# Altium schematic sheet SMPS_Section.SchDoc
size A4
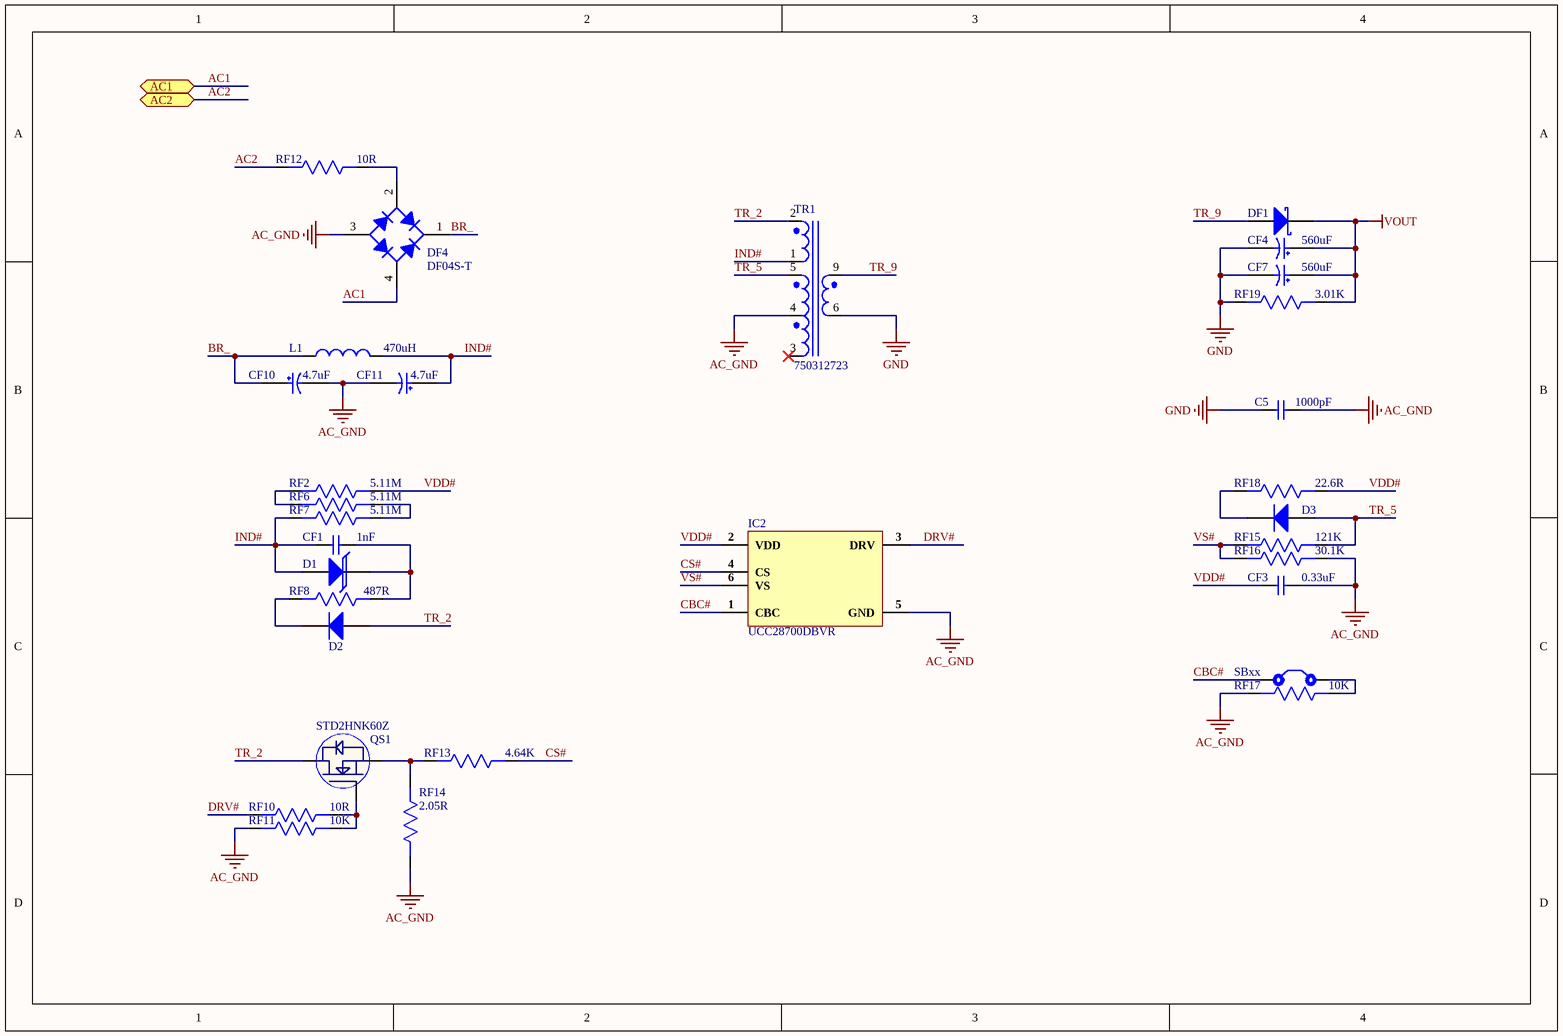
[diagram p0: SMPS_Section.SchDoc]

## Parts
C5  1000pF  [RAD-0.4]
CF1  1nF  [Cap0603]
CF3  0.33uF  [Cap0603]
CF4  560uF  [EEE-TC1A561UV]
CF7  560uF  [EEE-TC1A561UV]
CF10  4.7uF  [ULR2G4R7MNL1GS]
CF11  4.7uF  [ULR2G4R7MNL1GS]
D1  SMBJP6KE82A-TP  [SMB]  (value not drawn)
D2  MURS160-13  [SMB]  (value not drawn)
D3  RS1B-13-F  [SMA]  (value not drawn)
DF1  B340LB-13-F  [SMB]  (value not drawn)
DF4  DF04S-T  [DF04S-T]
IC2  UCC28700DBVR  [SOT-23-6]
L1  470uH  [84474C]
QS1  STD2HNK60Z  [STD2HNK60Z]
RF2  5.11M  [RES 0805]
RF6  5.11M  [RES 0805]
RF7  5.11M  [RES 0805]
RF8  487R  [Res0402]
RF10  10R  [Res0402]
RF11  10K  [Res0402]
RF12  10R  [RES 2512]
RF13  4.64K  [Res-0201]
RF14  2.05R  [Res0402]
RF15  121K  [Res0402]
RF16  30.1K  [Res0402]
RF17  10K  [Res0402]
RF18  22.6R  [Res0402]
RF19  3.01K  [Res-0201]
SBxx  Solder Bridge  [Solder Bridge]  (value not drawn)
TR1  750312723  [750312723]

## Ports
AC1 (bidir), AC2 (bidir)

## Nets
AC_GND: C5.2 CF3.2 CF10.2 CF11.2 DF4.3(-) IC2.5(GND) RF11.2 RF14.2 RF16.1 RF17.2 TR1.4
GND: C5.1 CF4.2 CF7.2 RF19.2 TR1.6
VOUT: CF4.1 CF7.1 DF1.2(K) RF19.1
AC1: DF4.4 ; port AC1
AC2: RF12.2 ; port AC2
BR_: CF10.1 DF4.1(+) L1.1
CBC#: IC2.1(CBC) SBxx.1
CS#: IC2.4(CS) RF13.1
DRV#: IC2.3(DRV) RF10.2
IND#: CF1.1 CF11.1 D1.1(A) L1.2 RF7.2 TR1.1
TR_2: D2.1(A) QS1.2(D) TR1.2
TR_5: D3.1(A) RF15.1 TR1.5
TR_9: DF1.1(A) TR1.9
VDD#: CF3.1 IC2.2(VDD) RF2.1 RF18.1
VS#: IC2.6(VS) RF15.2 RF16.2
NetCF1_2: CF1.2 D1.2(K) RF8.1
NetD2_2: D2.2(K) RF8.2
NetD3_2: D3.2(K) RF18.2
NetDF4_2: DF4.2(-) RF12.1
NetQS1_1: QS1.1(G) RF10.1 RF11.1
NetQS1_3: QS1.3(S) RF13.2 RF14.1
NetRF2_2: RF2.2 RF6.2
NetRF6_1: RF6.1 RF7.1
NetRF17_1: RF17.1 SBxx.2

Not connected (* = marked no-connect by the designer): TR1 3(NC)*

## Library data of the parts
C5 = 440LD10-R: CAP CER 1000PF 760VAC Y5U RADIAL; Manufacturer: Vishay; Voltage Rating: 300V; Lead/Base Style: Straight; Voltage: 760V; Dissipation Factor: 2%; Voltage Rating (DC): 400V; Capacitance: 1nF; Tolerance: 20%; Voltage Rating (AC): 500V; Lead Diameter: 0.81mm; Lead Length: 28.8mm; Supplier 1: Allied Electronics; Manufacturer Part Number: 440LD10-R; RoHS: Yes; Category: Ceramic Capacitors; Stock 1: 1070; Pricing 1: 1=0.59200, 25=0.46900, 100=0.45900, 250=0.43900, 500=0.40800, 1000=0.38800, 2500=0.37700 (USD); Mount: Through Hole,PCB; Case/Package: Radial; Weight: 0.01lb; Min Operating Temperature: -30°C; Max Operating Temperature: 125°C; Dielectric: Y5U; Termination: Radial; Resistor Type: Ceramic; Packaging: Bulk; Package Quantity: 250; Diameter: 9.3mm; Length: 2inch; Height: 5.7mm; Lead Pitch: 9.5mm; Width: 0.25inch; Height - Seated (Max): 0.492inch; Depth: 5.6mm; Radiation Hardening: No; Lead Free: Lead Free; REACH SVHC: Unknown; ComponentLink1URL: https://datasheet.ciiva.com/5383/440l-239711-5383856.pdf?src-supplier=Mouser; ComponentLink1Description: https://datasheet.ciiva.com/5383/440l-239711-5383856.pdf?src-supplier=Mouser; ComponentLink2URL: https://datasheet.ciiva.com/15164/getdatasheetpartid-107669-15164784.pdf?src-supplier=Verical; ComponentLink2Description: https://datasheet.ciiva.com/15164/getdatasheetpartid-107669-15164784.pdf?src-supplier=Verical; ComponentLink3URL: https://datasheet.ciiva.com/197/440lseries-197823.pdf?src-supplier=Digi-Key; ComponentLink3Description: https://datasheet.ciiva.com/197/440lseries-197823.pdf?src-supplier=Digi-Key; ComponentLink4URL: https://datasheet.ciiva.com/8031/1838975-8031887.pdf?src-supplier=Element14; ComponentLink4Description: https://datasheet.ciiva.com/8031/1838975-8031887.pdf?src-supplier=Element14; Supplier Part Number 1: 70079820
CF1 = 0603B102K201CT: CAP CER 1000PF 200V X7R 0603; Manufacturer: Walsin Technologies; Tolerance: 10%; Supplier 1: Digi-Key; Manufacturer Part Number: 0603B102K201CT; RoHS: No; Category: Ceramic Capacitors; Stock 1: 60399; Pricing 1: 1=0.10000, 10=0.06800, 50=0.03740, 100=0.03050, 500=0.02180, 1000=0.01712 (USD); Case/Package: 0603; Case Code (Metric): 1608; Case Code (Imperial): 0603; Min Operating Temperature: -55°C; Max Operating Temperature: 125°C; Voltage Rating: 200V; Packaging: Cut Tape; Voltage Rating (DC): 200V; Capacitance: 1nF; Dielectric: X7R; REACH SVHC: Unknown; ComponentLink1URL: http://www.farnell.com/datasheets/1958513.pdf?src-supplier=Farnell; ComponentLink1Description: http://www.farnell.com/datasheets/1958513.pdf?src-supplier=Farnell; ComponentLink2URL: http://www.farnell.com/datasheets/1958513.pdf?src-supplier=Element14; ComponentLink2Description: http://www.farnell.com/datasheets/1958513.pdf?src-supplier=Element14; ComponentLink3URL: http://www.passivecomponent.com/wp-content/uploads/2018/10/MLCC.pdf?src-supplier=Digi-Key; ComponentLink3Description: http://www.passivecomponent.com/wp-content/uploads/2018/10/MLCC.pdf?src-supplier=Digi-Key; Supplier Part Number 1: 1292-1379-1-ND
CF3 = CGA3E3X7R1H334M080AB: CAP CER 0.33UF 50V X7R 0603; Manufacturer: TDK; Capacitance: 330nF; Tolerance: 20%; Supplier 1: Digi-Key; Manufacturer Part Number: CGA3E3X7R1H334M080AB; RoHS: Yes; Category: Ceramic Capacitors; Stock 1: 4397; Pricing 1: 1=0.26000, 10=0.17600, 50=0.11760, 100=0.10000, 500=0.07056, 1000=0.06174 (USD); Mount: Surface Mount; Case/Package: 0603; Weight: 7.1E-05oz; Case Code (Imperial): 0603; Case Code (Metric): 1608; Min Operating Temperature: -55°C; Max Operating Temperature: 125°C; Dielectric: X7R; Termination: SMD/SMT; Voltage Rating (DC): 50V; Package Quantity: 4000; Packaging: Tape and Reel; Voltage Rating: 50V; Length: 0.063inch; Height: 0.8mm; Width: 0.031inch; Thickness: 0.035inch; Ratings: AEC-Q200; ComponentLink1URL: http://www.mouser.com/ds/2/400/lcc_automotive_general_en-843974.pdf?src-supplier=Mouser; ComponentLink1Description: http://www.mouser.com/ds/2/400/lcc_automotive_general_en-843974.pdf?src-supplier=Mouser; ComponentLink2URL: http://product.tdk.com/capacitor/mlcc/class/print_detail_pdf.php?lang=en&part_no=CGA3E3X7R1H334M080AB&src-supplier=Avnet; ComponentLink2Description: http://product.tdk.com/capacitor/mlcc/class/print_detail_pdf.php?lang=en&part_no=CGA3E3X7R1H334M080AB&src-supplier=Avnet; ComponentLink3URL: https://product.tdk.com/info/en/catalog/datasheets/mlcc_automotive_general_en.pdf?src-supplier=Digi-Key; ComponentLink3Description: https://product.tdk.com/info/en/catalog/datasheets/mlcc_automotive_general_en.pdf?src-supplier=Digi-Key; Supplier Part Number 1: 445-181020-1-ND
CF4 CF7 = EEE-TC1A561UV: CAP ALUM 560UF 20% 10V SMD; Manufacturer: Panasonic; Supplier 1: Digi-Key; Manufacturer Part Number: EEE-TC1A561UV; Stock 1: 500; Pricing 1: 1=1.23000, 10=0.96800, 50=0.83860, 100=0.72560 (USD); ComponentLink1URL: http://datasheet.octopart.com/EEE-TC1A561UV-Panasonic-datasheet-136612400.pdf?src-supplier=Electro+Sonic; ComponentLink1Description: http://datasheet.octopart.com/EEE-TC1A561UV-Panasonic-datasheet-136612400.pdf?src-supplier=Electro+Sonic; Supplier Part Number 1: P124843CT-ND
CF10 CF11 = ULR2G4R7MNL1GS: CAP ALUM 4.7UF 20% 400V SMD; Manufacturer: Nichicon; Ripple Current: 35mA; Leakage Current: 100uA; Life (Hours): 3000Hour; Dissipation Factor: 0.25%; Supplier 1: Digi-Key; Manufacturer Part Number: ULR2G4R7MNL1GS; RoHS: Yes; Category: Aluminum Electrolytic Capacitors; Stock 1: 108237; Pricing 1: 1=0.77000, 10=0.56900, 50=0.45540, 100=0.39030 (USD); Mount: Surface Mount; Case/Package: SMD/SMT; Min Operating Temperature: -40°C; Max Operating Temperature: 105°C; Voltage Rating (DC): 400V; Tolerance: 20%; Capacitance: 4.7uF; Packaging: Tape and Reel; Package Quantity: 500; Termination: SMD/SMT; Voltage Rating: 400V; Voltage: 400V; Diameter: 10mm; Length: 10mm; Height: 10mm; Height - Seated (Max): 0.433inch; Lead Pitch: 4.5mm; Lead Free: Lead Free; ComponentLink1URL: https://datasheet.ciiva.com/6317/e-lr-6317191.pdf?src-supplier=Digi-Key; ComponentLink1Description: https://datasheet.ciiva.com/6317/e-lr-6317191.pdf?src-supplier=Digi-Key; ComponentLink2URL: https://datasheet.ciiva.com/6317/e-lr-6317193.pdf?src-supplier=Digi-Key; ComponentLink2Description: https://datasheet.ciiva.com/6317/e-lr-6317193.pdf?src-supplier=Digi-Key; Supplier Part Number 1: 493-6709-1-ND
D1 = SMBJP6KE82A-TP: TVS DIODE 70.1V 113V DO214AA; Manufacturer: MCC; Number of Unidirectional Channels: 1; Min Breakdown Voltage: 77.9V; Max Surge Current: 5.4A; Peak Pulse Power: 600W; Power Line Protection: No; Breakdown Voltage: 86.1V; Polarity: Unidirectional; Supplier 1: Digi-Key; Manufacturer Part Number: SMBJP6KE82A-TP; RoHS: Yes; Category: TVS Diodes; Stock 1: 960; Pricing 1: 1=0.38000, 10=0.28000, 100=0.19500, 500=0.12350, 1000=0.10075 (USD); Mount: Surface Mount; Number of Pins: 2; Min Operating Temperature: -55°C; Max Operating Temperature: 175°C; Package Quantity: 1; Reverse Standoff Voltage: 70.1V; Packaging: Tape and Reel; Clamping Voltage: 113V; Number of Channels: 1; Termination: SMD/SMT; Peak Pulse Current: 5.4A; Resistor Type: Zener; ComponentLink1URL: https://datasheet.ciiva.com/334/smbjp6ke6-8ca-smbjp6ke550cado-214aa-334273.pdf?src-supplier=Digi-Key; ComponentLink1Description: https://datasheet.ciiva.com/334/smbjp6ke6-8ca-smbjp6ke550cado-214aa-334273.pdf?src-supplier=Digi-Key; ComponentLink2URL: https://datasheet.ciiva.com/334/smbjp6ke6-8ca-smbjp6ke550cado-214aa-334274.pdf?src-supplier=Digi-Key; ComponentLink2Description: https://datasheet.ciiva.com/334/smbjp6ke6-8ca-smbjp6ke550cado-214aa-334274.pdf?src-supplier=Digi-Key; ComponentLink3URL: https://datasheet.ciiva.com/334/smbjp6ke6-8ca-smbjp6ke550cado-214aa-334275.pdf?src-supplier=Digi-Key; ComponentLink3Description: https://datasheet.ciiva.com/334/smbjp6ke6-8ca-smbjp6ke550cado-214aa-334275.pdf?src-supplier=Digi-Key; Supplier Part Number 1: SMBJP6KE82A-TPMSCT-ND
D2 = MURS160-13: DIODE GEN PURP 600V 1A SMB; Manufacturer: Diodes; Manufacturer Part Number: MURS160-13-F; Reverse Recovery Time: 50ns; Element Configuration: Single; Max Reverse Current: 5uA; Forward Voltage: 1.25V; Peak Non-Repetitive Surge Current: 35A; Polarity: Standard; Capacitance: 45pF; Natural Thermal Resistance: 15°C/W; Supplier 1: Digi-Key; RoHS: Yes; Category: Rectifier Diodes; Stock 1: 63486; Pricing 1: 1=0.38000, 10=0.28200, 100=0.19700, 500=0.12474, 1000=0.10176 (USD); Mount: Surface Mount; Case/Package: SMB; Number of Pins: 2; Weight: 0.00328oz; Contact Plating: Tin,Matte; Min Operating Temperature: -55°C; Max Operating Temperature: 150°C; Forward Current: 1A; Packaging: Tape and Reel; Max Repetitive Reverse Voltage (Vrrm): 600V; Max Surge Current: 35A; Package Quantity: 3000; Recovery Time: 50ns; Reverse Voltage (DC): 600V; Average Rectified Current: 1A; Max Forward Surge Current (Ifsm): 35A; Voltage Rating (DC): 600V; Current Rating: 1A; Output Current: 1A; Max Reverse Voltage (DC): 600V; Current: 1A; Voltage: 600V; Length: 4.57mm; Height: 2.42mm; Width: 3.94mm; Radiation Hardening: No; REACH SVHC: No SVHC; Lead Free: Lead Free; ComponentLink1URL: https://datasheet.ciiva.com/913/ds30130-913616.pdf?src-supplier=Avnet; ComponentLink1Description: https://datasheet.ciiva.com/913/ds30130-913616.pdf?src-supplier=Avnet; ComponentLink2URL: https://datasheet.ciiva.com/16200/ds30130-16200054.pdf?src-supplier=Future+Electronics; ComponentLink2Description: https://datasheet.ciiva.com/16200/ds30130-16200054.pdf?src-supplier=Future+Electronics; ComponentLink3URL: https://datasheet.ciiva.com/7964/ds30130-7964281.pdf?src-supplier=Element14; ComponentLink3Description: https://datasheet.ciiva.com/7964/ds30130-7964281.pdf?src-supplier=Element14; ComponentLink4URL: https://datasheet.ciiva.com/913/ds30130-913595.pdf?src-supplier=Digi-Key; ComponentLink4Description: https://datasheet.ciiva.com/913/ds30130-913595.pdf?src-supplier=Digi-Key; ComponentLink5URL: https://datasheet.ciiva.com/913/ds30130-913596.pdf?src-supplier=Digi-Key; ComponentLink5Description: https://datasheet.ciiva.com/913/ds30130-913596.pdf?src-supplier=Digi-Key; ComponentLink6URL: https://datasheet.ciiva.com/25947/ds30130-25947388.pdf?src-supplier=Avnet+Europe; ComponentLink6Description: https://datasheet.ciiva.com/25947/ds30130-25947388.pdf?src-supplier=Avnet+Europe; ComponentLink7URL: https://datasheet.ciiva.com/913/ds30130-913597.pdf?src-supplier=Digi-Key; ComponentLink7Description: https://datasheet.ciiva.com/913/ds30130-913597.pdf?src-supplier=Digi-Key; ComponentLink8URL: https://datasheet.ciiva.com/8303/ds30130-8303182.pdf?src-supplier=Avnet; ComponentLink8Description: https://datasheet.ciiva.com/8303/ds30130-8303182.pdf?src-supplier=Avnet; Supplier Part Number 1: MURS160-FDICT-ND
D3 = RS1B-13-F: Diode Switching 100V 1A 2Pin SMA; Manufacturer: Diodes; Reverse Recovery Time: 150ns; Peak Non-Repetitive Surge Current: 30A; Element Configuration: Single; Max Reverse Current: 5uA; Polarity: Standard; Capacitance: 15pF; Forward Voltage: 1.3V; Supplier 1: Digi-Key; Manufacturer Part Number: RS1B-13-F; RoHS: Yes; Category: Rectifier Diodes; Stock 1: 119805; Pricing 1: 1=0.43000, 10=0.28300, 100=0.14140, 500=0.10504, 1000=0.07676, 2000=0.07474 (USD); Mount: Surface Mount; Case/Package: SMA; Number of Pins: 2; Weight: 0.002258oz; Min Operating Temperature: -65°C; Max Operating Temperature: 150°C; Max Repetitive Reverse Voltage (Vrrm): 100V; Forward Current: 1A; Reverse Voltage (DC): 100V; Average Rectified Current: 1A; Voltage Rating (DC): 100V; Current Rating: 1A; Output Current: 1A; Max Surge Current: 30A; Packaging: Tape and Reel; Package Quantity: 5000; Recovery Time: 150ns; Max Reverse Voltage (DC): 100V; Length: 4.6mm; Height: 2.1mm; Width: 2.92mm; Radiation Hardening: No; Lead Free: Lead Free; ComponentLink1URL: https://datasheet.ciiva.com/34302/1541360-34302413.pdf?src-supplier=Jameco; ComponentLink1Description: https://datasheet.ciiva.com/34302/1541360-34302413.pdf?src-supplier=Jameco; ComponentLink2URL: https://datasheet.ciiva.com/15144/getdatasheetpartid-71158-15144443.pdf?src-supplier=Verical; ComponentLink2Description: https://datasheet.ciiva.com/15144/getdatasheetpartid-71158-15144443.pdf?src-supplier=Verical; Supplier Part Number 1: RS1B-FDICT-ND
DF1 = B340LB-13-F: DIODE SCHOTTKY 40V 3A SMB; Manufacturer: Diodes; Max Reverse Current: 2mA; Peak Non-Repetitive Surge Current: 70A; Element Configuration: Single; Forward Voltage: 450mV; Polarity: Standard; Capacitance: 180pF; Supplier 1: Digi-Key; Manufacturer Part Number: B340LB-13-F; RoHS: Yes; Category: Schottky Diodes; Stock 1: 48742; Pricing 1: 1=0.40000, 10=0.31800, 100=0.22730, 500=0.17272, 1000=0.13635 (USD); Mount: Surface Mount; Case/Package: SMB; Number of Pins: 2; Weight: 0.00328oz; Min Operating Temperature: -55°C; Max Operating Temperature: 125°C; Packaging: Tape and Reel; Average Rectified Current: 3A; Max Reverse Voltage (DC): 40V; Forward Current: 3A; Package Quantity: 3000; Max Repetitive Reverse Voltage (Vrrm): 40V; Max Forward Surge Current (Ifsm): 70A; Voltage Rating (DC): 40V; Output Current: 3A; Current Rating: 3A; Termination: SMD/SMT; Current: 3A; Voltage: 40V; Length: 4.57mm; Height: 2.5mm; Width: 3.94mm; Radiation Hardening: No; Lead Free: Lead Free; REACH SVHC: No SVHC; ComponentLink1URL: https://datasheet.ciiva.com/25946/ds30240-25946736.pdf?src-supplier=Avnet+Europe; ComponentLink1Description: https://datasheet.ciiva.com/25946/ds30240-25946736.pdf?src-supplier=Avnet+Europe; ComponentLink2URL: https://datasheet.ciiva.com/4715/ds30240-71143-4715794.pdf?src-supplier=Mouser; ComponentLink2Description: https://datasheet.ciiva.com/4715/ds30240-71143-4715794.pdf?src-supplier=Mouser; ComponentLink3URL: https://datasheet.ciiva.com/26949/getdatasheetpartid-146318-26949355.pdf?src-supplier=Verical; ComponentLink3Description: https://datasheet.ciiva.com/26949/getdatasheetpartid-146318-26949355.pdf?src-supplier=Verical; ComponentLink4URL: https://datasheet.ciiva.com/8303/ds30240-8303077.pdf?src-supplier=Avnet; ComponentLink4Description: https://datasheet.ciiva.com/8303/ds30240-8303077.pdf?src-supplier=Avnet; ComponentLink5URL: https://datasheet.ciiva.com/1177/ds30240-1177479.pdf?src-supplier=Element14; ComponentLink5Description: https://datasheet.ciiva.com/1177/ds30240-1177479.pdf?src-supplier=Element14; ComponentLink6URL: https://datasheet.ciiva.com/914/ds30240-914106.pdf?src-supplier=Digi-Key; ComponentLink6Description: https://datasheet.ciiva.com/914/ds30240-914106.pdf?src-supplier=Digi-Key; ComponentLink7URL: https://datasheet.ciiva.com/914/ds30240-914107.pdf?src-supplier=Digi-Key; ComponentLink7Description: https://datasheet.ciiva.com/914/ds30240-914107.pdf?src-supplier=Digi-Key; ComponentLink8URL: https://datasheet.ciiva.com/914/ds30240-914108.pdf?src-supplier=Digi-Key; ComponentLink8Description: https://datasheet.ciiva.com/914/ds30240-914108.pdf?src-supplier=Digi-Key; ComponentLink9URL: https://datasheet.ciiva.com/16380/ds30240-16380877.pdf?src-supplier=Future+Electronics; ComponentLink9Description: https://datasheet.ciiva.com/16380/ds30240-16380877.pdf?src-supplier=Future+Electronics; Supplier Part Number 1: B340LB-FDICT-ND
DF4 = DF04S-T: RECT BRIDGE GPP 1A 400V DFS; Manufacturer: Diodes; Element Configuration: Single; Max Reverse Current: 10uA; Forward Voltage: 1.1V; Max Surge Current: 50A; Number of Elements: 1; Reverse Voltage (DC): 280V; Supplier 1: Newark; Manufacturer Part Number: DF04S-T; RoHS: Yes; Category: Rectifier Diodes; Mount: Surface Mount; Case/Package: SMD/SMT; Number of Pins: 4; Weight: 0.010547oz; Min Operating Temperature: -65°C; Max Operating Temperature: 150°C; Packaging: Tape and Reel; Package Quantity: 1; Max Repetitive Reverse Voltage (Vrrm): 400V; Termination: SMD/SMT; Forward Current: 1A; Peak Non-Repetitive Surge Current: 50A; Max Forward Surge Current (Ifsm): 50A; Average Rectified Current: 1A; Length: 8.51mm; Height: 3.4mm; Width: 6.5mm; Radiation Hardening: No; Lead Free: Lead Free; ComponentLink1URL: https://datasheet.ciiva.com/34302/1540050-34302383.pdf?src-supplier=Jameco; ComponentLink1Description: https://datasheet.ciiva.com/34302/1540050-34302383.pdf?src-supplier=Jameco; ComponentLink2URL: https://datasheet.ciiva.com/26788/df04s-t-26788074.pdf?src-supplier=IIIC; ComponentLink2Description: https://datasheet.ciiva.com/26788/df04s-t-26788074.pdf?src-supplier=IIIC; ComponentLink3URL: https://datasheet.ciiva.com/25958/ds17001-25958714.pdf?src-supplier=Avnet+Europe; ComponentLink3Description: https://datasheet.ciiva.com/25958/ds17001-25958714.pdf?src-supplier=Avnet+Europe; ComponentLink4URL: https://datasheet.ciiva.com/11195/ds17001-11195727.pdf?src-supplier=Avnet; ComponentLink4Description: https://datasheet.ciiva.com/11195/ds17001-11195727.pdf?src-supplier=Avnet; Supplier Part Number 1: 60AC8755
IC2 = UCC28700DBVR: IC REG CTRLR FLYBK ISO SOT23-6; Manufacturer: Texas Instruments; Isolation: Isolated; Max Frequency: 140kHz; Duty Cycle: 99%; Operating Supply Current: 2.65mA; Number of Outputs: 1; Output Voltage: 14V; Min Supply Voltage: 9V; Max Supply Voltage: 35V; Nominal Supply Current: 2.1mA; Output Current: 25mA; Topology: Flyback; Fault Protection: Over Voltage; Supplier 1: Digi-Key; Manufacturer Part Number: UCC28700DBVR; RoHS: Yes; Category: Voltage Regulators - Switching; Stock 1: 3760; Pricing 1: 1=1.16000, 10=1.03300, 25=0.98000, 100=0.75250, 250=0.66500, 500=0.63000, 1000=0.49000 (USD); Mount: Surface Mount; Case/Package: SOT-23-6; Number of Pins: 6; Min Operating Temperature: -20°C; Max Operating Temperature: 125°C; Max Duty Cycle: 99%; Switching Frequency: 140kHz; Package Quantity: 3000; Packaging: Tape and Reel; Lead Free: Lead Free; ComponentLink1URL: http://components.arrow.com/part/dataview/0323_06089130?src-supplier=Arrow+Europe; ComponentLink1Description: http://components.arrow.com/part/dataview/0323_06089130?src-supplier=Arrow+Europe; ComponentLink2URL: http://components.arrow.com/part/dataview/51462043S196667N7713?src-supplier=Arrow+Electronics; ComponentLink2Description: http://components.arrow.com/part/dataview/51462043S196667N7713?src-supplier=Arrow+Electronics; ComponentLink3URL: http://www.ti.com/general/docs/lit/getliterature.tsp?genericPartNumber=UCC28702&&fileType=pdf&src-supplier=Avnet; ComponentLink3Description: http://www.ti.com/general/docs/lit/getliterature.tsp?genericPartNumber=UCC28702&&fileType=pdf&src-supplier=Avnet; ComponentLink4URL: http://www.ti.com/lit/ds/symlink/ucc28700.pdf?src-supplier=Digi-Key; ComponentLink4Description: http://www.ti.com/lit/ds/symlink/ucc28700.pdf?src-supplier=Digi-Key; ComponentLink5URL: http://www.ti.com/lit/gpn/ucc28700?src-supplier=Mouser; ComponentLink5Description: http://www.ti.com/lit/gpn/ucc28700?src-supplier=Mouser; Supplier Part Number 1: 296-39536-1-ND
L1 = 84474C: Ind Power Wirewound 470uH 10% 140mA 1812; Manufacturer: Murata; DC Resistance (DCR): 8.5R; Shielding: Unshielded; Supplier 1: Digi-Key; Manufacturer Part Number: 84474C; RoHS: Yes; Category: Fixed Inductors; Stock 1: 1958; Pricing 1: 1=0.53000, 5=0.51000, 10=0.49300, 25=0.44200, 50=0.37400, 100=0.32300, 250=0.23800, 500=0.22950, 1000=0.22610 (USD); Mount: Surface Mount; Case/Package: Nonstandard; Min Operating Temperature: -40°C; Max Operating Temperature: 125°C; Inductance: 470uH; Max DC Current: 140mA; Tolerance: 10%; Packaging: Tape and Reel; Package Quantity: 2000; Termination: SMD/SMT; Resistor Type: Wirewound; Current Rating: 140mA; Length: 0.177inch; Height: 2.6mm; Depth: 3.6mm; Width: 3.3mm; Height - Seated (Max): 0.114inch; Radiation Hardening: No; ComponentLink1URL: https://datasheet.ciiva.com/8506/kmp-8400-8506026.pdf?src-supplier=Avnet; ComponentLink1Description: https://datasheet.ciiva.com/8506/kmp-8400-8506026.pdf?src-supplier=Avnet; Supplier Part Number 1: 811-3640-1-ND
QS1 = STD2HNK60Z: MOSFET N-CH 600V 2A DPAK; Manufacturer: STMicroelectronics; Fall Time: 50ns; Rise Time: 30ns; Turn-Off Delay Time: 13ns; Turn-On Delay Time: 10ns; Gate to Source Voltage (Vgs): 30V; On-State Resistance: 4.8R; Max Power Dissipation: 45W; Number of Elements: 1; Input Capacitance: 280pF; Element Configuration: Single; Supplier 1: Digi-Key; Manufacturer Part Number: STD2HNK60Z; RoHS: Yes; Category: MOSFETs; Stock 1: 11805; Pricing 1: 1=0.98000, 10=0.87900, 25=0.83440, 100=0.62580, 500=0.53044, 1000=0.43210 (USD); Mount: Surface Mount; Case/Package: DPAK; Number of Pins: 3; Min Operating Temperature: -55°C; Max Operating Temperature: 150°C; Continuous Drain Current (ID): 2A; Drain to Source Voltage (Vdss): 600V; Packaging: Tape and Reel; Drain to Source Breakdown Voltage: 600V; Power Dissipation: 45W; Drain to Source Resistance: 4.8R; Package Quantity: 2500; Rds On Max: 4.8R; Radiation Hardening: No; Lead Free: Lead Free; ComponentLink1URL: https://datasheet.ciiva.com/16220/cd00003701-16220226.pdf?src-supplier=Future+Electronics; ComponentLink1Description: https://datasheet.ciiva.com/16220/cd00003701-16220226.pdf?src-supplier=Future+Electronics; ComponentLink2URL: https://datasheet.ciiva.com/26791/std2hnk60z-26791859.pdf?src-supplier=IIIC; ComponentLink2Description: https://datasheet.ciiva.com/26791/std2hnk60z-26791859.pdf?src-supplier=IIIC; ComponentLink3URL: https://datasheet.ciiva.com/6368/cd00003701-6368539.pdf?src-supplier=Digi-Key; ComponentLink3Description: https://datasheet.ciiva.com/6368/cd00003701-6368539.pdf?src-supplier=Digi-Key; ComponentLink4URL: https://datasheet.ciiva.com/6368/cd00003701-6368541.pdf?src-supplier=Digi-Key; ComponentLink4Description: https://datasheet.ciiva.com/6368/cd00003701-6368541.pdf?src-supplier=Digi-Key; Supplier Part Number 1: 497-6192-1-ND
RF2 RF6 RF7 = RK73H2ATTD5114F: RES 5.11M OHM 1% 1/4W 0805; Manufacturer: KOA Speer; Power Rating: 125mW; Resistance: 5.11MR; Voltage Rating: 150V; Temperature Coefficient: 400ppm/°C; Supplier 1: Digi-Key; Manufacturer Part Number: RK73H2ATTD5114F; RoHS: Yes; Category: Chip SMD Resistors; Stock 1: 19860; Pricing 1: 1=0.10000, 10=0.03000, 100=0.01240, 1000=0.00557, 2500=0.00483 (USD); Case/Package: 0805; Case Code (Imperial): 0805; Case Code (Metric): 2012; Min Operating Temperature: -55°C; Max Operating Temperature: 155°C; Packaging: Tape and Reel; Package Quantity: 5000; Tolerance: 1%; Termination: SMD/SMT; Voltage Rating (DC): 150V; Length: 2mm; Height: 0.5mm; Width: 1.25mm; Lead Free: Lead Free; ComponentLink1URL: http://components.arrow.com/part/dataview/39731086S7548087N5146?src-supplier=Arrow+Electronics; ComponentLink1Description: http://components.arrow.com/part/dataview/39731086S7548087N5146?src-supplier=Arrow+Electronics; ComponentLink2URL: http://www.koaspeer.com/catimages/Products/RK73H/RK73H.pdf?src-supplier=Mouser; ComponentLink2Description: http://www.koaspeer.com/catimages/Products/RK73H/RK73H.pdf?src-supplier=Mouser; Supplier Part Number 1: 2019-RK73H2ATTD5114FCT-ND
RF8 = RK73H1ETTP4870F: RES 487 OHM 1% 1/10W 0402; Manufacturer: KOA Speer; Power Rating: 63mW; Voltage Rating: 50V; Temperature Coefficient: 100ppm/°C; Supplier 1: Digi-Key; Manufacturer Part Number: RK73H1ETTP4870F; RoHS: Yes; Category: Chip SMD Resistors; Stock 1: 19738; Pricing 1: 1=0.10000, 10=0.02200, 100=0.00890, 1000=0.00398, 2500=0.00345, 5000=0.00285 (USD); Case/Package: 0402; Case Code (Imperial): 0402; Case Code (Metric): 1005; Min Operating Temperature: -55°C; Max Operating Temperature: 155°C; Resistance: 487R; Tolerance: 1%; Packaging: Tape and Reel; Package Quantity: 10000; Resistor Type: Thick Film; Termination: SMD/SMT; Voltage Rating (DC): 50V; Length: 1mm; Height: 0.35mm; Width: 0.5mm; Depth: 0.5mm; Military Standard: Not; Lead Free: Lead Free; ComponentLink1URL: https://datasheet.ciiva.com/5554/rk73h-5554092.pdf?src-supplier=Mouser; ComponentLink1Description: https://datasheet.ciiva.com/5554/rk73h-5554092.pdf?src-supplier=Mouser; Supplier Part Number 1: 2019-RK73H1ETTP4870FCT-ND
RF10 = RK73B1ETTP100J: RES 10 OHM 5% 1/10W 0402; Manufacturer: KOA Speer; Power Rating: 63mW; Voltage Rating: 50V; Temperature Coefficient: 200ppm/°C; Supplier 1: Digi-Key; Manufacturer Part Number: RK73B1ETTP100J; RoHS: Yes; Category: Chip SMD Resistors; Stock 1: 424333; Pricing 1: 1=0.10000, 10=0.01500, 100=0.00590, 1000=0.00265, 2500=0.00230, 5000=0.00190 (USD); Mount: Surface Mount; Case/Package: 0402; Case Code (Imperial): 0402; Case Code (Metric): 1005; Min Operating Temperature: -55°C; Max Operating Temperature: 155°C; Tolerance: 5%; Packaging: Tape and Reel; Resistance: 10R; Package Quantity: 10000; Termination: SMD/SMT; Resistor Type: Thick Film; Voltage Rating (DC): 50V; Length: 1mm; Height: 0.35mm; Width: 0.5mm; Depth: 0.5mm; Military Standard: Not; Lead Free: Lead Free; ComponentLink1URL: https://datasheet.ciiva.com/27054/1876725-27054392.pdf?src-supplier=Jameco; ComponentLink1Description: https://datasheet.ciiva.com/27054/1876725-27054392.pdf?src-supplier=Jameco; ComponentLink2URL: https://datasheet.ciiva.com/5554/rk73b-5554335.pdf?src-supplier=Mouser; ComponentLink2Description: https://datasheet.ciiva.com/5554/rk73b-5554335.pdf?src-supplier=Mouser; Supplier Part Number 1: 2019-RK73B1ETTP100JCT-ND
RF11 RF17 = ERJ-2RKF1002X: RES SMD 10K OHM 1% 1/10W 0402; Manufacturer: Panasonic; Resistance: 10kR; Temperature Coefficient: 100ppm/°C; Power Rating: 100mW; Voltage Rating: 50V; Supplier 1: Digi-Key; Manufacturer Part Number: ERJ-2RKF1002X; RoHS: Yes; Category: Chip SMD Resistors; Stock 1: 15656546; Pricing 1: 1=0.10000, 10=0.02200, 100=0.00890, 1000=0.00398, 2500=0.00345, 5000=0.00285 (USD); Mount: Surface Mount; Case/Package: 0402; Number of Pins: 2; Contact Plating: Tin; Case Code (Metric): 1005; Case Code (Imperial): 0402; Min Operating Temperature: -55°C; Max Operating Temperature: 155°C; Tolerance: 1%; Resistor Type: Thick Film; Packaging: Tape and Reel; Package Quantity: 1; Number of Terminations: 2; Termination: SMD/SMT; Max Power Dissipation: 100mW; Voltage Rating (DC): 50V; Features: Automotive AEC-Q200; Length: 1mm; Height: 0.35mm; Width: 0.02inch; Depth: 0.5mm; Radiation Hardening: No; REACH SVHC: No SVHC; Military Standard: Not; Lead Free: Lead Free; ComponentLink1URL: https://datasheet.ciiva.com/11821/0900766b80f80784-11821171.pdf?src-supplier=RSComponents; ComponentLink1Description: https://datasheet.ciiva.com/11821/0900766b80f80784-11821171.pdf?src-supplier=RSComponents; ComponentLink2URL: https://datasheet.ciiva.com/16199/aoa0000ce2-16199478.pdf?src-supplier=Future+Electronics; ComponentLink2Description: https://datasheet.ciiva.com/16199/aoa0000ce2-16199478.pdf?src-supplier=Future+Electronics; ComponentLink3URL: https://datasheet.ciiva.com/17212/aoa0000ce2-17212102.pdf?src-supplier=Avnet+Europe; ComponentLink3Description: https://datasheet.ciiva.com/17212/aoa0000ce2-17212102.pdf?src-supplier=Avnet+Europe; ComponentLink4URL: https://datasheet.ciiva.com/24023/aoa0000ce2-24023017.pdf?src-supplier=Mouser; ComponentLink4Description: https://datasheet.ciiva.com/24023/aoa0000ce2-24023017.pdf?src-supplier=Mouser; ComponentLink5URL: https://datasheet.ciiva.com/28514/1678782-28514185.pdf?src-supplier=Element14; ComponentLink5Description: https://datasheet.ciiva.com/28514/1678782-28514185.pdf?src-supplier=Element14; ComponentLink6URL: https://datasheet.ciiva.com/43467/1678782-43467402.pdf?src-supplier=Farnell; ComponentLink6Description: https://datasheet.ciiva.com/43467/1678782-43467402.pdf?src-supplier=Farnell; ComponentLink7URL: https://datasheet.ciiva.com/27055/1987020-27055643.pdf?src-supplier=Jameco; ComponentLink7Description: https://datasheet.ciiva.com/27055/1987020-27055643.pdf?src-supplier=Jameco; ComponentLink8URL: https://datasheet.ciiva.com/48531/aoa0000ce2-48531069.pdf?src-supplier=Avnet; ComponentLink8Description: https://datasheet.ciiva.com/48531/aoa0000ce2-48531069.pdf?src-supplier=Avnet; ComponentLink9URL: https://datasheet.ciiva.com/9194/aoa0000ce2-9194142.pdf?src-supplier=Avnet; ComponentLink9Description: https://datasheet.ciiva.com/9194/aoa0000ce2-9194142.pdf?src-supplier=Avnet; ComponentLink10URL: https://datasheet.ciiva.com/16782/70260748-16782590.pdf?src-supplier=Allied+Electronics; ComponentLink10Description: https://datasheet.ciiva.com/16782/70260748-16782590.pdf?src-supplier=Allied+Electronics; ComponentLink11URL: https://datasheet.ciiva.com/16786/70260748-16786734.pdf?src-supplier=Allied+Electronics; ComponentLink11Description: https://datasheet.ciiva.com/16786/70260748-16786734.pdf?src-supplier=Allied+Electronics; ComponentLink12URL: https://datasheet.ciiva.com/30201/aoa0000ce2-30201022.pdf?src-supplier=Onlinecomponents.com; ComponentLink12Description: https://datasheet.ciiva.com/30201/aoa0000ce2-30201022.pdf?src-supplier=Onlinecomponents.com; Supplier Part Number 1: P10.0KLCT-ND
RF12 = 352210RJT: RES SMD 10 OHM 5% 3W 2512; Manufacturer: TE Connectivity CGS; Manufacturer Part Number: 1-2176230-4; Number of Resistors: 1; Temperature Coefficient: 200ppm/°C; Voltage Rating (DC): 250V; Supplier 1: Digi-Key; RoHS: No; Category: Chip SMD Resistors; Stock 1: 8393; Pricing 1: 1=0.56000, 10=0.46900, 100=0.31470, 1000=0.18411 (USD); Mount: Surface Mount; Case/Package: 2512; Case Code (Imperial): 2512; Case Code (Metric): 6432; Min Operating Temperature: -55°C; Max Operating Temperature: 105°C; Tolerance: 5%; Number of Terminations: 2; Power Rating: 3W; Termination: Solder; Voltage Rating: 250V; Packaging: Tape and Reel; Resistor Type: Thick Film,Power resistor; Resistance: 10R; Length: 6.35mm; Height: 1.1mm; Depth: 3.2mm; REACH SVHC: Unknown; ComponentLink1URL: http://uk.rs-online.com/webdocs/142d/0900766b8142d0f1.pdf?src-supplier=RSComponents; ComponentLink1Description: http://uk.rs-online.com/webdocs/142d/0900766b8142d0f1.pdf?src-supplier=RSComponents; ComponentLink2URL: http://www.farnell.com/datasheets/2007092.pdf?src-supplier=Farnell; ComponentLink2Description: http://www.farnell.com/datasheets/2007092.pdf?src-supplier=Farnell; ComponentLink3URL: http://www.farnell.com/datasheets/2007092.pdf?src-supplier=Element14; ComponentLink3Description: http://www.farnell.com/datasheets/2007092.pdf?src-supplier=Element14; ComponentLink4URL: https://www.te.com/commerce/DocumentDelivery/DDEController?Action=srchrtrv&DocNm=9-1773463-7&DocType=DS&DocLang=English&src-supplier=Digi-Key; ComponentLink4Description: https://www.te.com/commerce/DocumentDelivery/DDEController?Action=srchrtrv&DocNm=9-1773463-7&DocType=DS&DocLang=English&src-supplier=Digi-Key; ComponentLink5URL: http://www.te.com/commerce/DocumentDelivery/DDEController?Action=srchrtrv&DocNm=9-1773463-7&DocType=DS&DocLang=English&src-supplier=Digi-Key; ComponentLink5Description: http://www.te.com/commerce/DocumentDelivery/DDEController?Action=srchrtrv&DocNm=9-1773463-7&DocType=DS&DocLang=English&src-supplier=Digi-Key; ComponentLink6URL: http://www.farnell.com/datasheets/2007092.pdf?src-supplier=Newark; ComponentLink6Description: http://www.farnell.com/datasheets/2007092.pdf?src-supplier=Newark; Supplier Part Number 1: A121124CT-ND
RF13 = ERJ-1GNF4641C: RES SMD 4.64K OHM 1% 1/20W 0201; Manufacturer: Panasonic; Manufacturer Part Number: ERJ-1GEF4641C; Voltage Rating: 25V; Resistance: 4.64kR; Power Rating: 50mW; Temperature Coefficient: 200ppm/°C; Voltage Rating (DC): 15V; Supplier 1: Mouser; RoHS: Yes; Category: Chip SMD Resistors; Stock 1: 40860; Pricing 1: 1=0.17000, 50=0.02600, 100=0.01500, 500=0.01200, 1000=0.00900, 5000=0.00700 (USD); Mount: Surface Mount; Case/Package: 0201; Case Code (Imperial): 0201; Case Code (Metric): 0603; Contact Plating: Tin; Min Operating Temperature: -55°C; Max Operating Temperature: 125°C; Packaging: Tape and Reel; Tolerance: 1%; Package Quantity: 1; Resistor Type: Thick Film; Number of Terminations: 2; Max Power Dissipation: 50mW; Length: 0.024inch; Height: 0.01inch; Width: 0.3mm; Lead Free: Lead Free; ComponentLink1URL: https://datasheet.ciiva.com/2440/erj-g-r-e-rev08-2440120.pdf?src-supplier=Digi-Key; ComponentLink1Description: https://datasheet.ciiva.com/2440/erj-g-r-e-rev08-2440120.pdf?src-supplier=Digi-Key; ComponentLink2URL: https://datasheet.ciiva.com/2440/erj-g-r-e-rev08-2440121.pdf?src-supplier=Digi-Key; ComponentLink2Description: https://datasheet.ciiva.com/2440/erj-g-r-e-rev08-2440121.pdf?src-supplier=Digi-Key; ComponentLink3URL: https://datasheet.ciiva.com/2440/erj-g-r-e-rev08-2440122.pdf?src-supplier=Digi-Key; ComponentLink3Description: https://datasheet.ciiva.com/2440/erj-g-r-e-rev08-2440122.pdf?src-supplier=Digi-Key; ComponentLink4URL: https://datasheet.ciiva.com/30176/aoa0000ce2-30176906.pdf?src-supplier=Onlinecomponents.com; ComponentLink4Description: https://datasheet.ciiva.com/30176/aoa0000ce2-30176906.pdf?src-supplier=Onlinecomponents.com; Supplier Part Number 1: 667-ERJ-1GEF4641C
RF14 = RK73H1ETTP2R05F: Res 2.05 Ohm 1% 1/10W 0402; Manufacturer: KOA Speer; Power Rating: 62.5mW; Voltage Rating (DC): 50V; Temperature Coefficient: 100ppm/°C; Supplier 1: Digi-Key; Manufacturer Part Number: RK73H1ETTP2R05F; RoHS: No; Category: Chip SMD Resistors; Pricing 1: 1000=0.00421 (USD); Case/Package: 0402; Resistance: 2.05R; Length: 1mm; Width: 500um; Supplier Part Number 1: 2019-RK73H1ETTP2R05FCT-ND
RF15 = ERJ-2RKF1213X: RES SMD 121K OHM 1% 1/10W 0402; Manufacturer: Panasonic; Resistance: 121kR; Power Rating: 100mW; Voltage Rating: 50V; Temperature Coefficient: 100ppm/°C; Supplier 1: Digi-Key; Manufacturer Part Number: ERJ-2RKF1213X; RoHS: Yes; Category: Chip SMD Resistors; Stock 1: 23579; Pricing 1: 1=0.10000, 10=0.02200, 100=0.00890, 1000=0.00398, 2500=0.00345, 5000=0.00285 (USD); Mount: Surface Mount; Case/Package: 0402; Case Code (Metric): 1005; Case Code (Imperial): 0402; Contact Plating: Tin; Min Operating Temperature: -55°C; Max Operating Temperature: 155°C; Packaging: Tape and Reel; Tolerance: 1%; Package Quantity: 1; Resistor Type: Thick Film; Number of Terminations: 2; Termination: SMD/SMT; Max Power Dissipation: 100mW; Voltage Rating (DC): 50V; Features: Automotive AEC-Q200; Length: 1mm; Height: 0.016inch; Width: 0.02inch; Depth: 0.5mm; REACH SVHC: No SVHC; Military Standard: Not; Lead Free: Lead Free; ComponentLink1URL: https://datasheet.ciiva.com/30175/aoa0000ce2-30175510.pdf?src-supplier=Onlinecomponents.com; ComponentLink1Description: https://datasheet.ciiva.com/30175/aoa0000ce2-30175510.pdf?src-supplier=Onlinecomponents.com; ComponentLink2URL: https://datasheet.ciiva.com/28531/1678782-28531400.pdf?src-supplier=Element14; ComponentLink2Description: https://datasheet.ciiva.com/28531/1678782-28531400.pdf?src-supplier=Element14; ComponentLink3URL: https://datasheet.ciiva.com/9186/aoa0000ce2-9186073.pdf?src-supplier=Avnet; ComponentLink3Description: https://datasheet.ciiva.com/9186/aoa0000ce2-9186073.pdf?src-supplier=Avnet; ComponentLink4URL: https://datasheet.ciiva.com/46441/426256-46441257.pdf?src-supplier=Element14; ComponentLink4Description: https://datasheet.ciiva.com/46441/426256-46441257.pdf?src-supplier=Element14; ComponentLink5URL: https://datasheet.ciiva.com/28683/1678782-28683147.pdf?src-supplier=Element14; ComponentLink5Description: https://datasheet.ciiva.com/28683/1678782-28683147.pdf?src-supplier=Element14; ComponentLink6URL: https://datasheet.ciiva.com/24069/aoa0000ce2-24069100.pdf?src-supplier=Mouser; ComponentLink6Description: https://datasheet.ciiva.com/24069/aoa0000ce2-24069100.pdf?src-supplier=Mouser; Supplier Part Number 1: P121KLCT-ND
RF16 = RK73H1ETTP3012F: RES 30.1K OHM 1% 1/10W 0402; Manufacturer: KOA Speer; Resistance: 30.1kR; Power Rating: 63mW; Voltage Rating: 50V; Temperature Coefficient: 100ppm/°C; Supplier 1: Digi-Key; Manufacturer Part Number: RK73H1ETTP3012F; RoHS: Yes; Category: Chip SMD Resistors; Stock 1: 324728; Pricing 1: 1=0.10000, 10=0.02200, 100=0.00890, 1000=0.00398, 2500=0.00345, 5000=0.00285 (USD); Mount: Surface Mount; Case/Package: 0402; Case Code (Imperial): 0402; Case Code (Metric): 1005; Min Operating Temperature: -55°C; Max Operating Temperature: 155°C; Tolerance: 1%; Packaging: Tape and Reel; Package Quantity: 10000; Resistor Type: Thick Film; Termination: SMD/SMT; Voltage Rating (DC): 50V; Length: 1mm; Height: 0.35mm; Width: 0.5mm; Depth: 0.5mm; Military Standard: Not; Lead Free: Lead Free; ComponentLink1URL: http://components.arrow.com/part/dataview/39721483S6492630N5146?src-supplier=Arrow+Electronics; ComponentLink1Description: http://components.arrow.com/part/dataview/39721483S6492630N5146?src-supplier=Arrow+Electronics; ComponentLink2URL: http://www.jameco.com/Jameco/Products/ProdDS/1883343.pdf?src-supplier=Jameco; ComponentLink2Description: http://www.jameco.com/Jameco/Products/ProdDS/1883343.pdf?src-supplier=Jameco; ComponentLink3URL: https://www.verical.com/server-webapp/html/getDatasheet?partID=170797&src-supplier=Verical; ComponentLink3Description: https://www.verical.com/server-webapp/html/getDatasheet?partID=170797&src-supplier=Verical; ComponentLink4URL: http://www.koaspeer.com/catimages/Products/RK73H/RK73H.pdf?src-supplier=Mouser; ComponentLink4Description: http://www.koaspeer.com/catimages/Products/RK73H/RK73H.pdf?src-supplier=Mouser; Supplier Part Number 1: 2019-RK73H1ETTP3012FCT-ND
RF18 = ERJ-2RKF22R6X: RES SMD 22.6 OHM 1% 1/10W 0402; Manufacturer: Panasonic; Power Rating: 100mW; Voltage Rating: 50V; Temperature Coefficient: 100ppm/°C; Supplier 1: Digi-Key; Manufacturer Part Number: ERJ-2RKF22R6X; RoHS: Yes; Category: Chip SMD Resistors; Stock 1: 139011; Pricing 1: 1=0.10000, 10=0.02200, 100=0.00890, 1000=0.00398, 2500=0.00345, 5000=0.00285 (USD); Mount: Surface Mount; Case/Package: 0402; Case Code (Metric): 1005; Case Code (Imperial): 0402; Contact Plating: Tin; Min Operating Temperature: -55°C; Max Operating Temperature: 155°C; Resistance: 22.6R; Tolerance: 1%; Packaging: Tape and Reel; Package Quantity: 1; Resistor Type: Thick Film; Number of Terminations: 2; Termination: SMD/SMT; Max Power Dissipation: 100mW; Voltage Rating (DC): 50V; Features: Automotive AEC-Q200; Length: 1mm; Height: 0.016inch; Width: 0.02inch; Depth: 0.5mm; Radiation Hardening: No; REACH SVHC: No SVHC; Military Standard: Not; ComponentLink1URL: https://datasheet.ciiva.com/43467/1678782-43467159.pdf?src-supplier=Farnell; ComponentLink1Description: https://datasheet.ciiva.com/43467/1678782-43467159.pdf?src-supplier=Farnell; ComponentLink2URL: https://datasheet.ciiva.com/22682/1678782-22682056.pdf?src-supplier=Element14; ComponentLink2Description: https://datasheet.ciiva.com/22682/1678782-22682056.pdf?src-supplier=Element14; ComponentLink3URL: https://datasheet.ciiva.com/30072/aoa0000ce2-30072009.pdf?src-supplier=Onlinecomponents.com; ComponentLink3Description: https://datasheet.ciiva.com/30072/aoa0000ce2-30072009.pdf?src-supplier=Onlinecomponents.com; ComponentLink4URL: https://datasheet.ciiva.com/24026/aoa0000ce2-24026219.pdf?src-supplier=Mouser; ComponentLink4Description: https://datasheet.ciiva.com/24026/aoa0000ce2-24026219.pdf?src-supplier=Mouser; ComponentLink5URL: https://datasheet.ciiva.com/22759/1678782-22759662.pdf?src-supplier=Farnell; ComponentLink5Description: https://datasheet.ciiva.com/22759/1678782-22759662.pdf?src-supplier=Farnell; ComponentLink6URL: https://datasheet.ciiva.com/46373/1678782-46373743.pdf?src-supplier=Element14; ComponentLink6Description: https://datasheet.ciiva.com/46373/1678782-46373743.pdf?src-supplier=Element14; Supplier Part Number 1: P22.6LCT-ND
RF19 = AC0201FR-073K01L: RES SMD 3.01K OHM 1% 1/20W 0201; Manufacturer: Yageo; Max Power Dissipation: 50mW; Temperature Coefficient: 200ppm/°C; Resistance: 3.01kR; Supplier 1: Digi-Key; Manufacturer Part Number: AC0201FR-073K01L; RoHS: Yes; Category: Chip SMD Resistors; Stock 1: 39278; Pricing 1: 1=0.10000, 10=0.05800, 100=0.02350, 1000=0.01055, 2500=0.00916, 5000=0.00756 (USD); Case/Package: 0201; Min Operating Temperature: -55°C; Max Operating Temperature: 155°C; Tolerance: 1%; Features: Moisture Resistant,Automotive AEC-Q200; Packaging: Tape and Reel; Resistor Type: Thick Film; Number of Terminations: 2; Length: 0.024inch; Height: 0.01inch; Width: 0.012inch; ComponentLink1URL: http://www.yageo.com/NewPortal/yageodocoutput?fileName=/pdf/R-Chip/PYu-AC_51_RoHS_L_6.pdf&src-supplier=Digi-Key; ComponentLink1Description: http://www.yageo.com/NewPortal/yageodocoutput?fileName=/pdf/R-Chip/PYu-AC_51_RoHS_L_6.pdf&src-supplier=Digi-Key; ComponentLink2URL: http://www.yageo.com/NewPortal/yageodocoutput?fileName=/pdf/R-Chip/PYu-AC_51_RoHS_L_5.pdf&src-supplier=Digi-Key; ComponentLink2Description: http://www.yageo.com/NewPortal/yageodocoutput?fileName=/pdf/R-Chip/PYu-AC_51_RoHS_L_5.pdf&src-supplier=Digi-Key; Supplier Part Number 1: YAG5205CT-ND
SBxx = Solder Bridge: Solder Bridge ON
TR1 = 750312723: FLYBACK XFRM WE-FB T-WIN; Manufacturer: Wurth Electronics Midcom; Frequency: 130kHz; Shielding: Shielded; Current Rating: 440mA; Inductance: 925uH; DC Resistance (DCR): 2.15R; Supplier 1: Digi-Key; Manufacturer Part Number: 750312723; RoHS: Yes; Category: Transformers; Stock 1: 109; Pricing 1: 1=5.18000, 10=5.11100, 50=4.79100, 100=4.31200, 500=3.83300 (USD); Mount: Through Hole; Min Operating Temperature: -40°C; Max Operating Temperature: 125°C; Packaging: Tray; Termination: Through Hole; Package Quantity: 130; Length: 20.45mm; Height: 10.2mm; Height - Seated (Max): 10.41mm; Width: 19.7mm; ComponentLink1URL: https://datasheet.ciiva.com/18573/750312723-18573722.pdf?src-supplier=Digi-Key; ComponentLink1Description: https://datasheet.ciiva.com/18573/750312723-18573722.pdf?src-supplier=Digi-Key; Supplier Part Number 1: 1297-1022-ND